# Altium schematic sheet ffultra_pressure.SchDoc
size A4; SheetNumber: 5; SheetTotal: 13
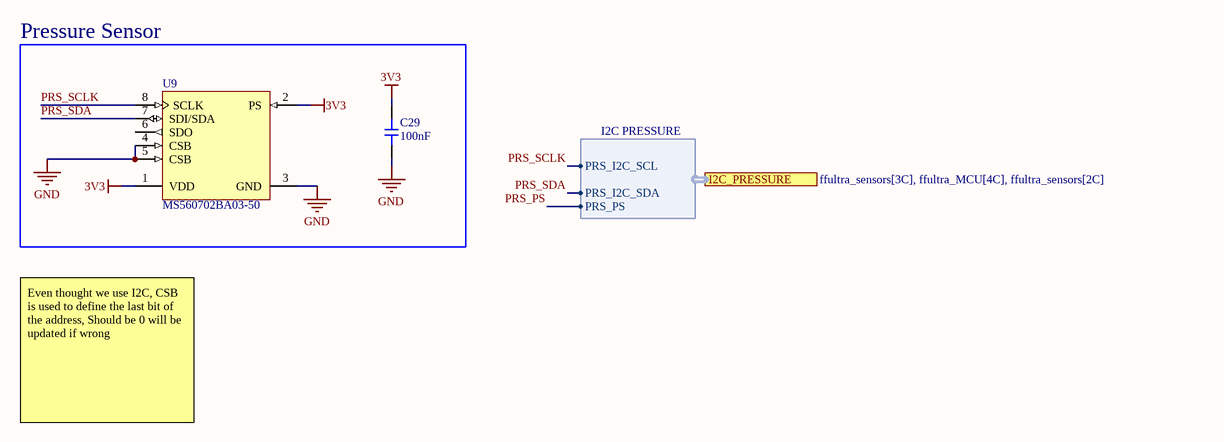
[diagram p0: ffultra_pressure.SchDoc]

## Parts
C29  value 100nF  [CAP-0402]  (hidden comment: CL05B104KO5NNNC)
U9  MS560702BA03-50  [TECO-MS560702BA03-50_V]

## Blocks framed on the sheet
Pressure Sensor: C29 U9

## Ports
I2C_PRESSURE (harness I2C PRESSURE, see ffultra_sensors[3C], ffultra_MCU[4C], ffultra_sensors[2C])

## Harnesses
I2C PRESSURE: PRS_I2C_SCL, PRS_I2C_SDA, PRS_PS

## Nets
3V3: C29.1 U9.1(VDD) U9.2(PS)
GND: C29.2 U9.3(GND) U9.4(CSB) U9.5(CSB)
PRS_PS: port I2C_PRESSURE.PRS_PS
PRS_SCLK: U9.8(SCLK) ; port I2C_PRESSURE.PRS_I2C_SCL
PRS_SDA: U9.7(SDI/SDA) ; port I2C_PRESSURE.PRS_I2C_SDA

Not connected (* = marked no-connect by the designer): U9 6(SDO)

## Notes on the sheet
- Even thought we use I2C, CSB is used to define the last bit of the address, Should be 0 will be updated if wrong

## Library data of the parts
C29 = CMP-001-00142-1: Capacitor, Ceramic (MLCC), 100nF, ±10%, 16V, X7R, ±10%, SMD 0402; Manufacturer: Samsung Electro-Mechanics; Design Item ID: CL05B104KO5NNNC; Source: jlcpcb_capacitors_basic.schlib; ComponentLink2URL: https://jlcpcb.com/partdetail/C1525; Voltage Rating: 16V; Tolerance: 10%; Temperature Coefficient: X7R; ComponentLink2Description: JLCPCB Part URL; ComponentLink1URL: https://datasheet.lcsc.com/lcsc/1810191219_Samsung-Electro-Mechanics-CL05B104KO5NNNC_C1525.pdf; JLCPCB Basic Part: Yes; JLCPCB Part Number: C1525; ComponentLink3URL: https://lcsc.com/product-detail/Multilayer-Ceramic-Capacitors-MLCC---SMD-SMT_Samsung-Electro-Mechanics-Samsung-Electro-Mechanics-CL05B104KO5NNNC_C1525.html; Manufacturer Part Number: CL05B104KO5NNNC; ComponentLink1Description: Datasheet; Case/Package: 0402; RoHS: Yes; Category: Capacitors - MLCC; ComponentLink3Description: LCSC Part URL
U9 = CMP-010-00034-3: Absolute, 4.35Psi Min, 15.95Psi Max, 0-3V, Rectangular, Surface Mount; Min Supply Voltage: 1.8V; Sensor Type: PRESSURE SENSOR,PEIZORESISTIVE; Max Supply Voltage: 3.6V; Mounting Technology: Surface Mount; Max Operating Temperature: 85°C; RoHS Compliant: Yes; Min Operating Temperature: -40°C; JLCPCB Part Number: C97627